# Altium schematic sheet LM27762DSSR.schdoc
size 127 x 101 mm
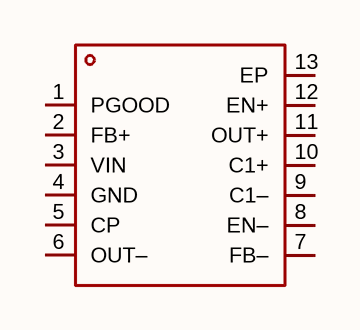
[diagram p0: LM27762DSSR.schdoc]

## Parts
U?  lm27762dssr  [WSON-12_L3.0-W2.0-P0.50-BL-EP]  (value not drawn)

## Nets

Not connected (* = marked no-connect by the designer): U? 1(PGOOD) 2(FB+) 3(VIN) 4(GND) 5(CP) 6(OUT–) 7(FB–) 8(EN–) 9(C1–) 10(C1+) 11(OUT+) 12(EN+) 13(EP)

## Library data of the parts
U? = lm27762dssr: LM27762 带有集成 LDO 的低噪声正负输出电荷泵; Manufacturer: TI(德州仪器); AddInBom: yes; ModelId: 75df7d26feb145b0ac5ce3287ea6d356; ModelName: WSON-12_L3.0-W2.0-H0.8-P0.50; ModelTransform: 79.527,118.8974,0,90,0,0,0,0,0; Function: 反相; Operating Voltage: 2.7V~5.5V; Output Voltage: -5V~-1.5V；1.5V~5V; Output Current: 250mA; Quiescent Current: 390uA; Output Resistance: 2.5Ω; Switching Frequency: 2MHz; PFM Mode: 支持; Symbol: LM27762DSSR; LCSC Part Name: 低噪声正负输出集成电荷泵加LDO; SupplierPart: C473398; ManufacturerPart: LM27762DSSR; Supplier Footprint: WSON-12-EP(2x3); JLCPCB Part Class: Extended Part; Datasheet: https://www.ti.com/cn/lit/ds/symlink/lm27762.pdf; Supplier: LCSC; ConvertToPcb: yes; FootprintName: WSON-12_L3.0-W2.0-P0.50-BL-EP; Energy Efficiency: -; Operating Temperature: -40℃~+85℃; Features: 自适应开关频率；过流保护；低纹波/低噪声架构；输出短路保护；低功耗待机